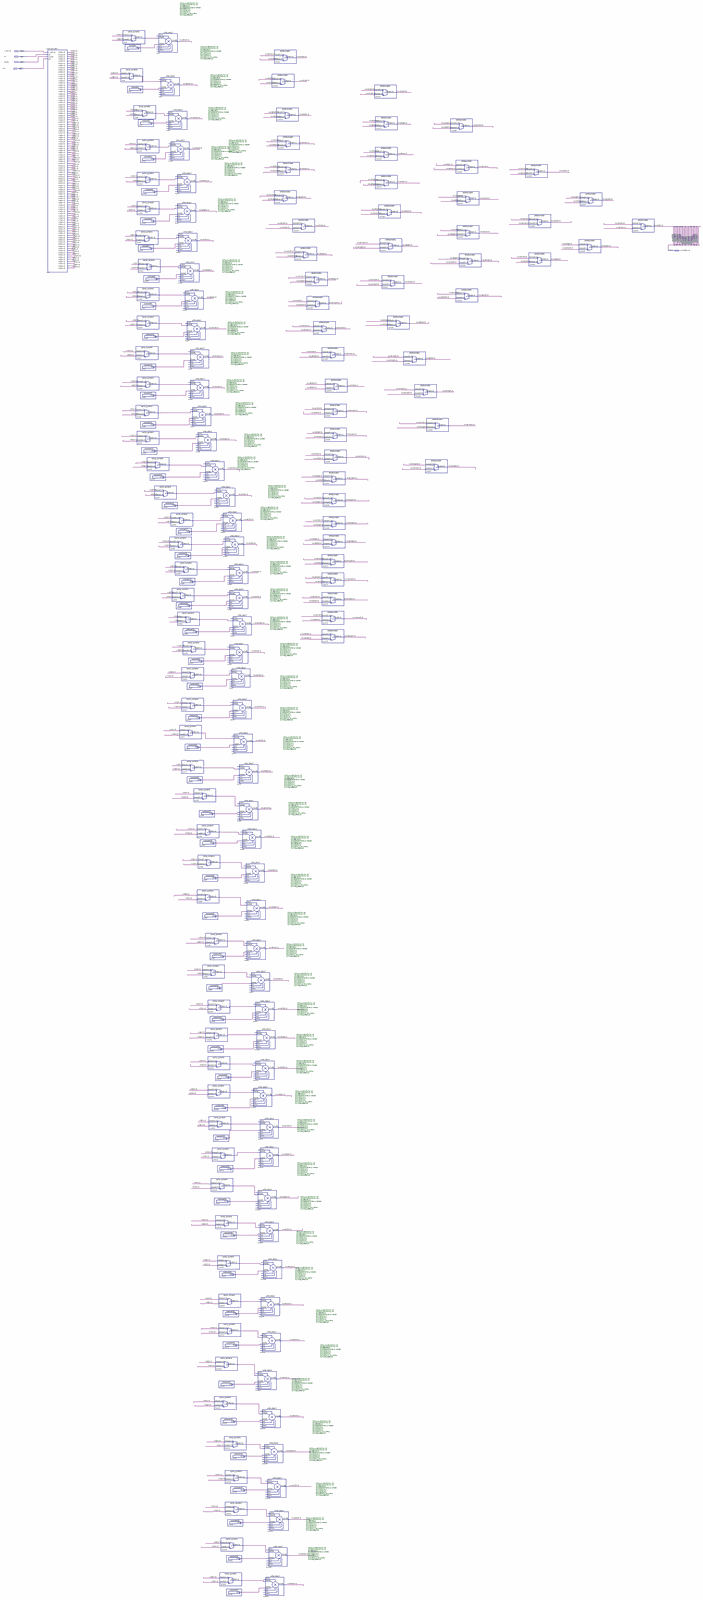
[diagram p0: schematic sheet, whole]
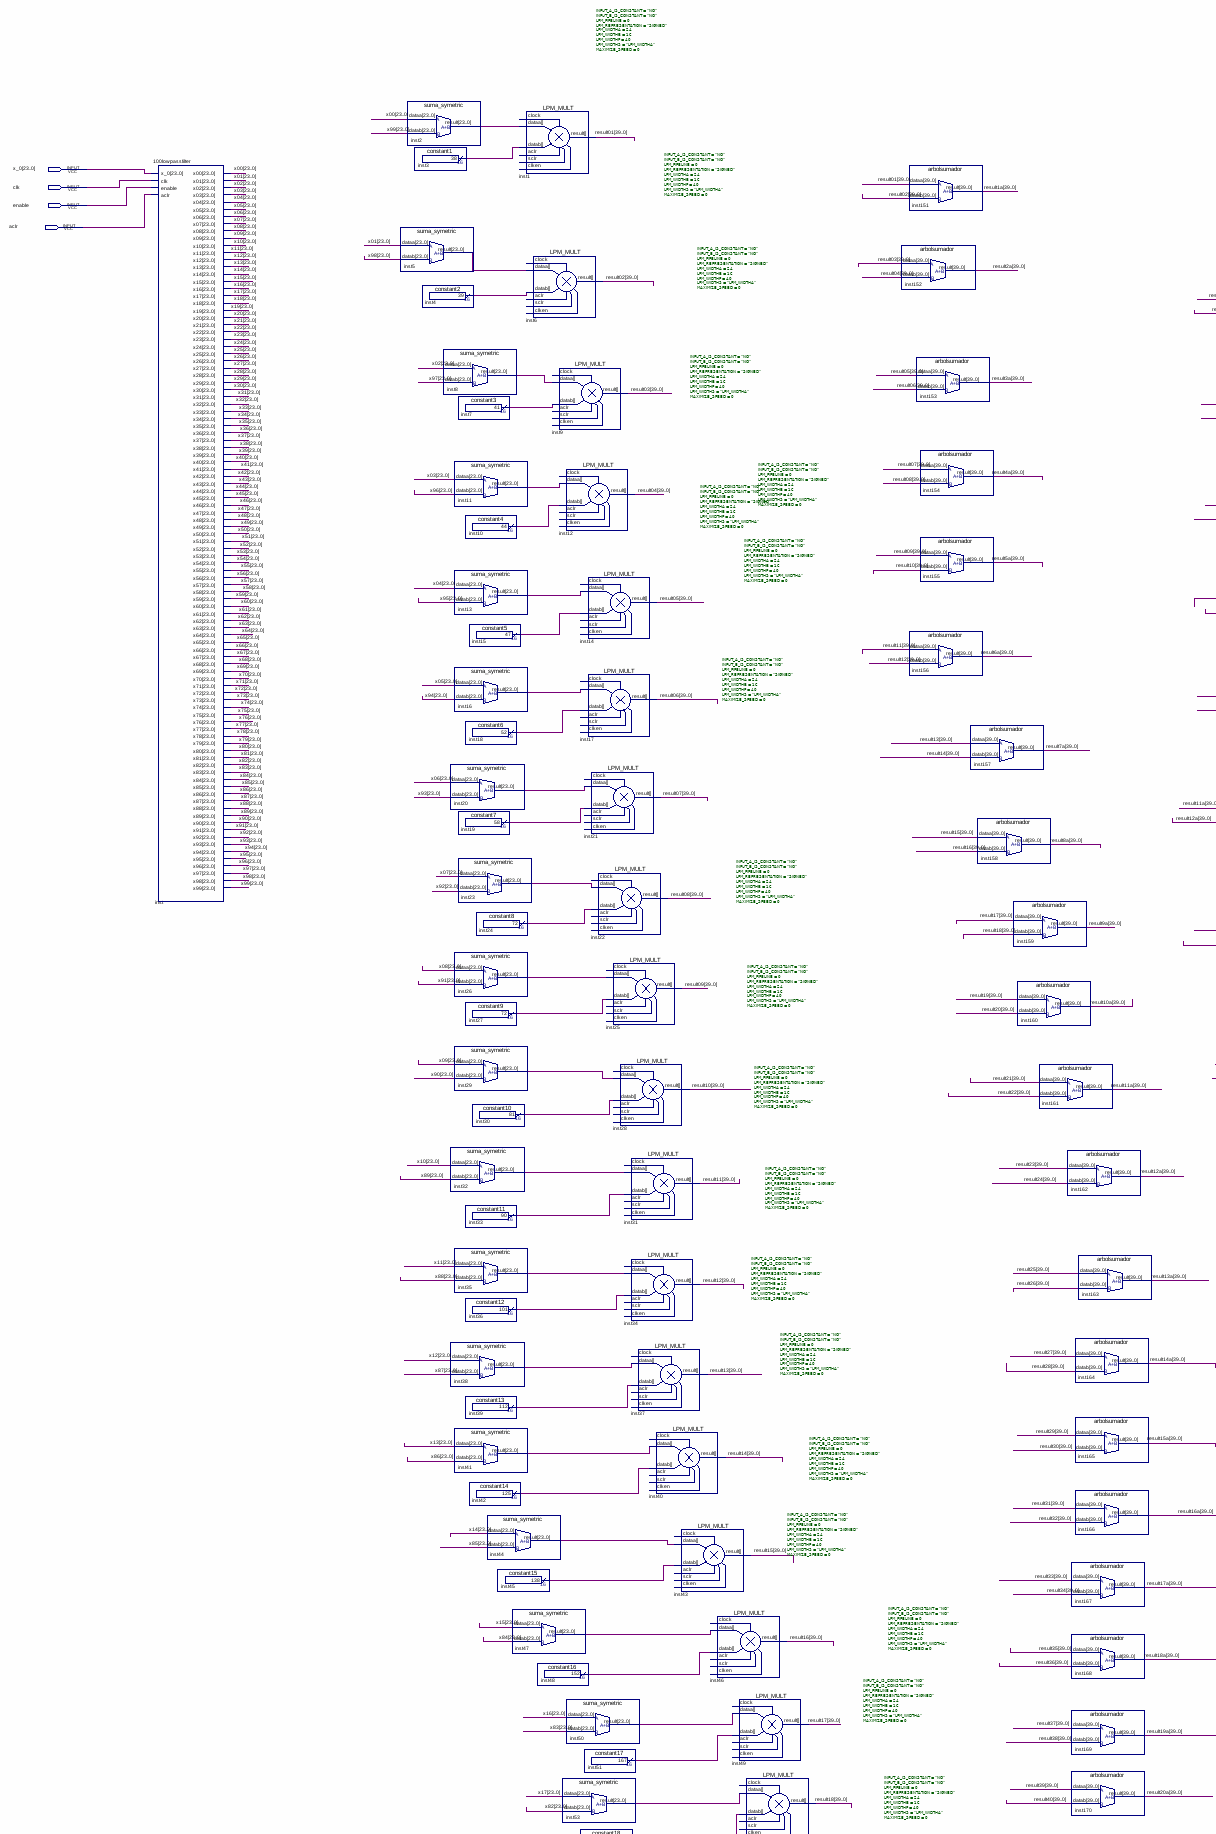
[diagram p1: schematic sheet, upper left part]
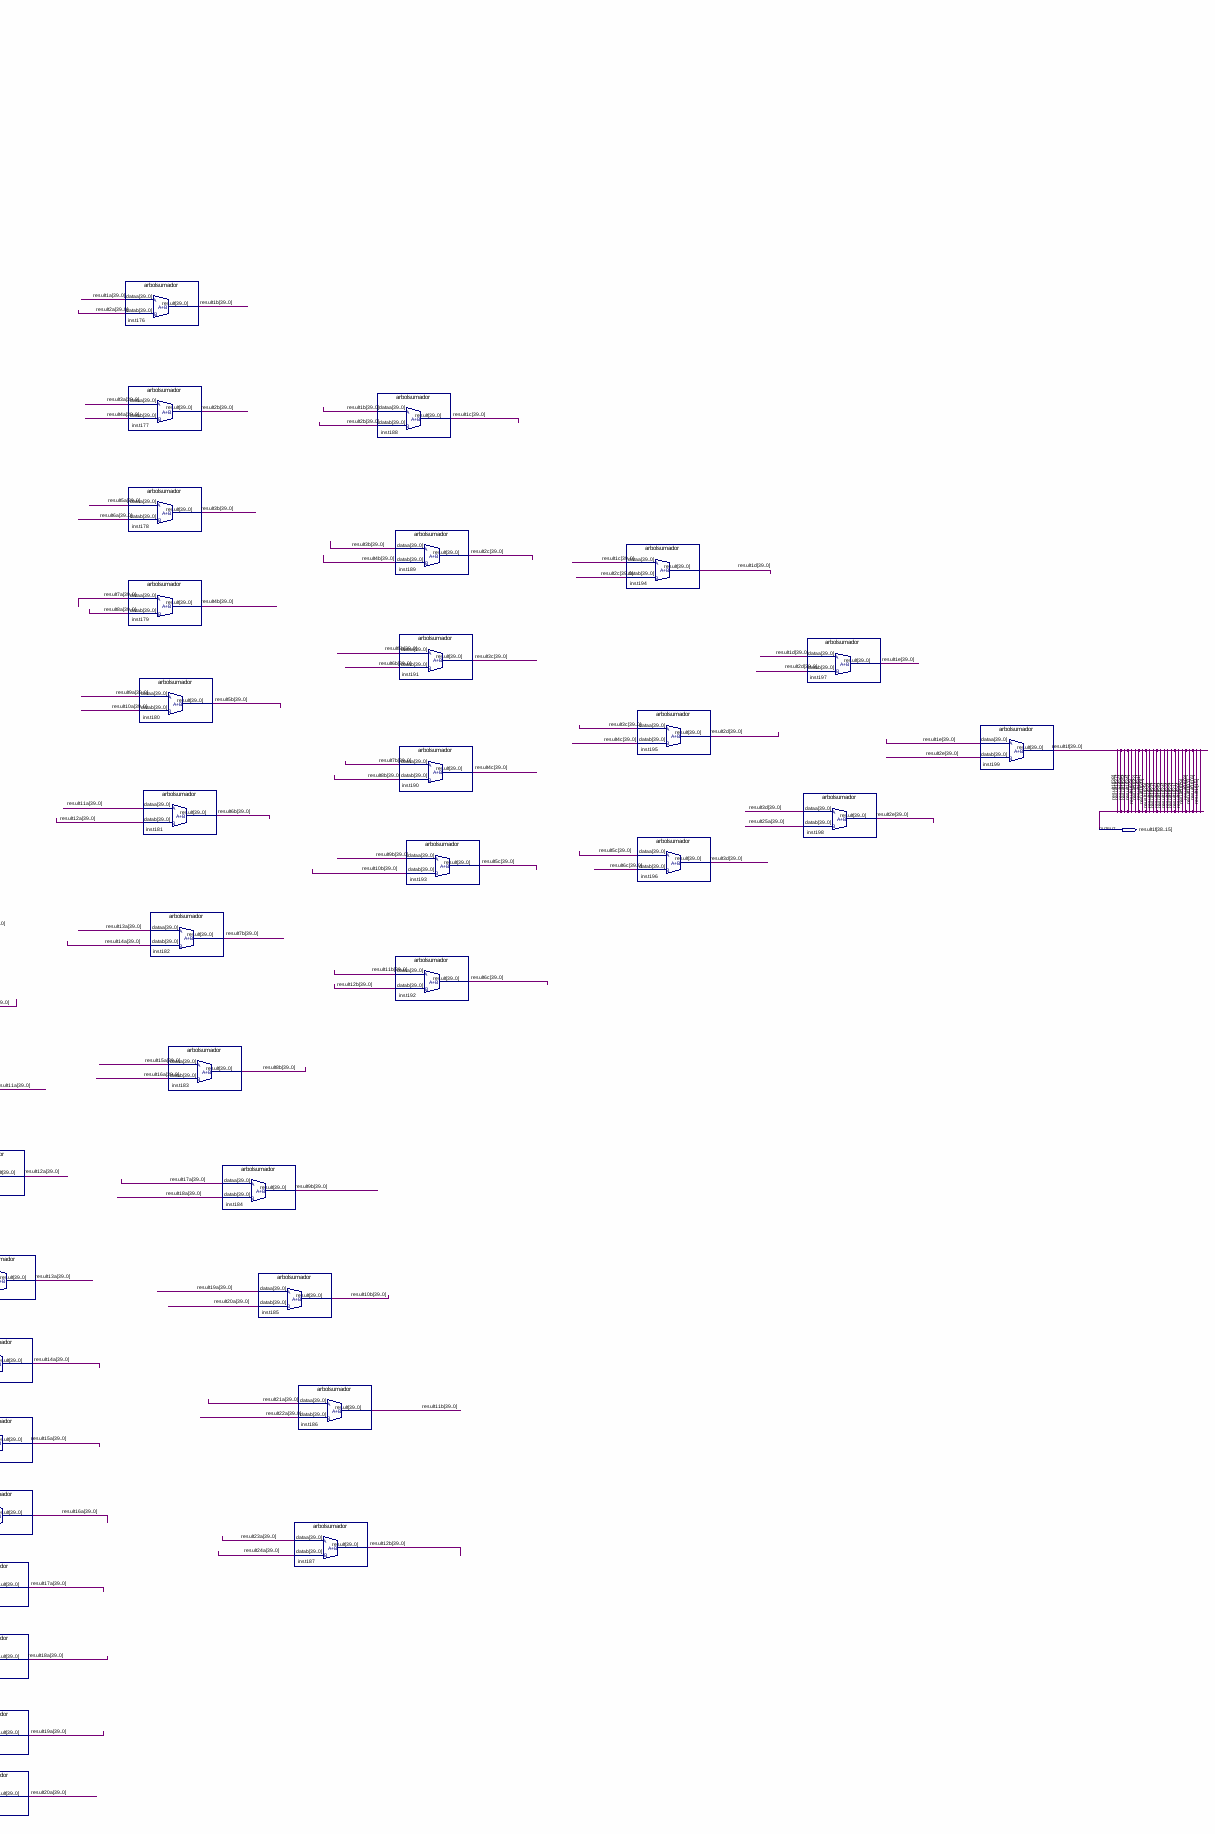
[diagram p2: schematic sheet, upper right part]
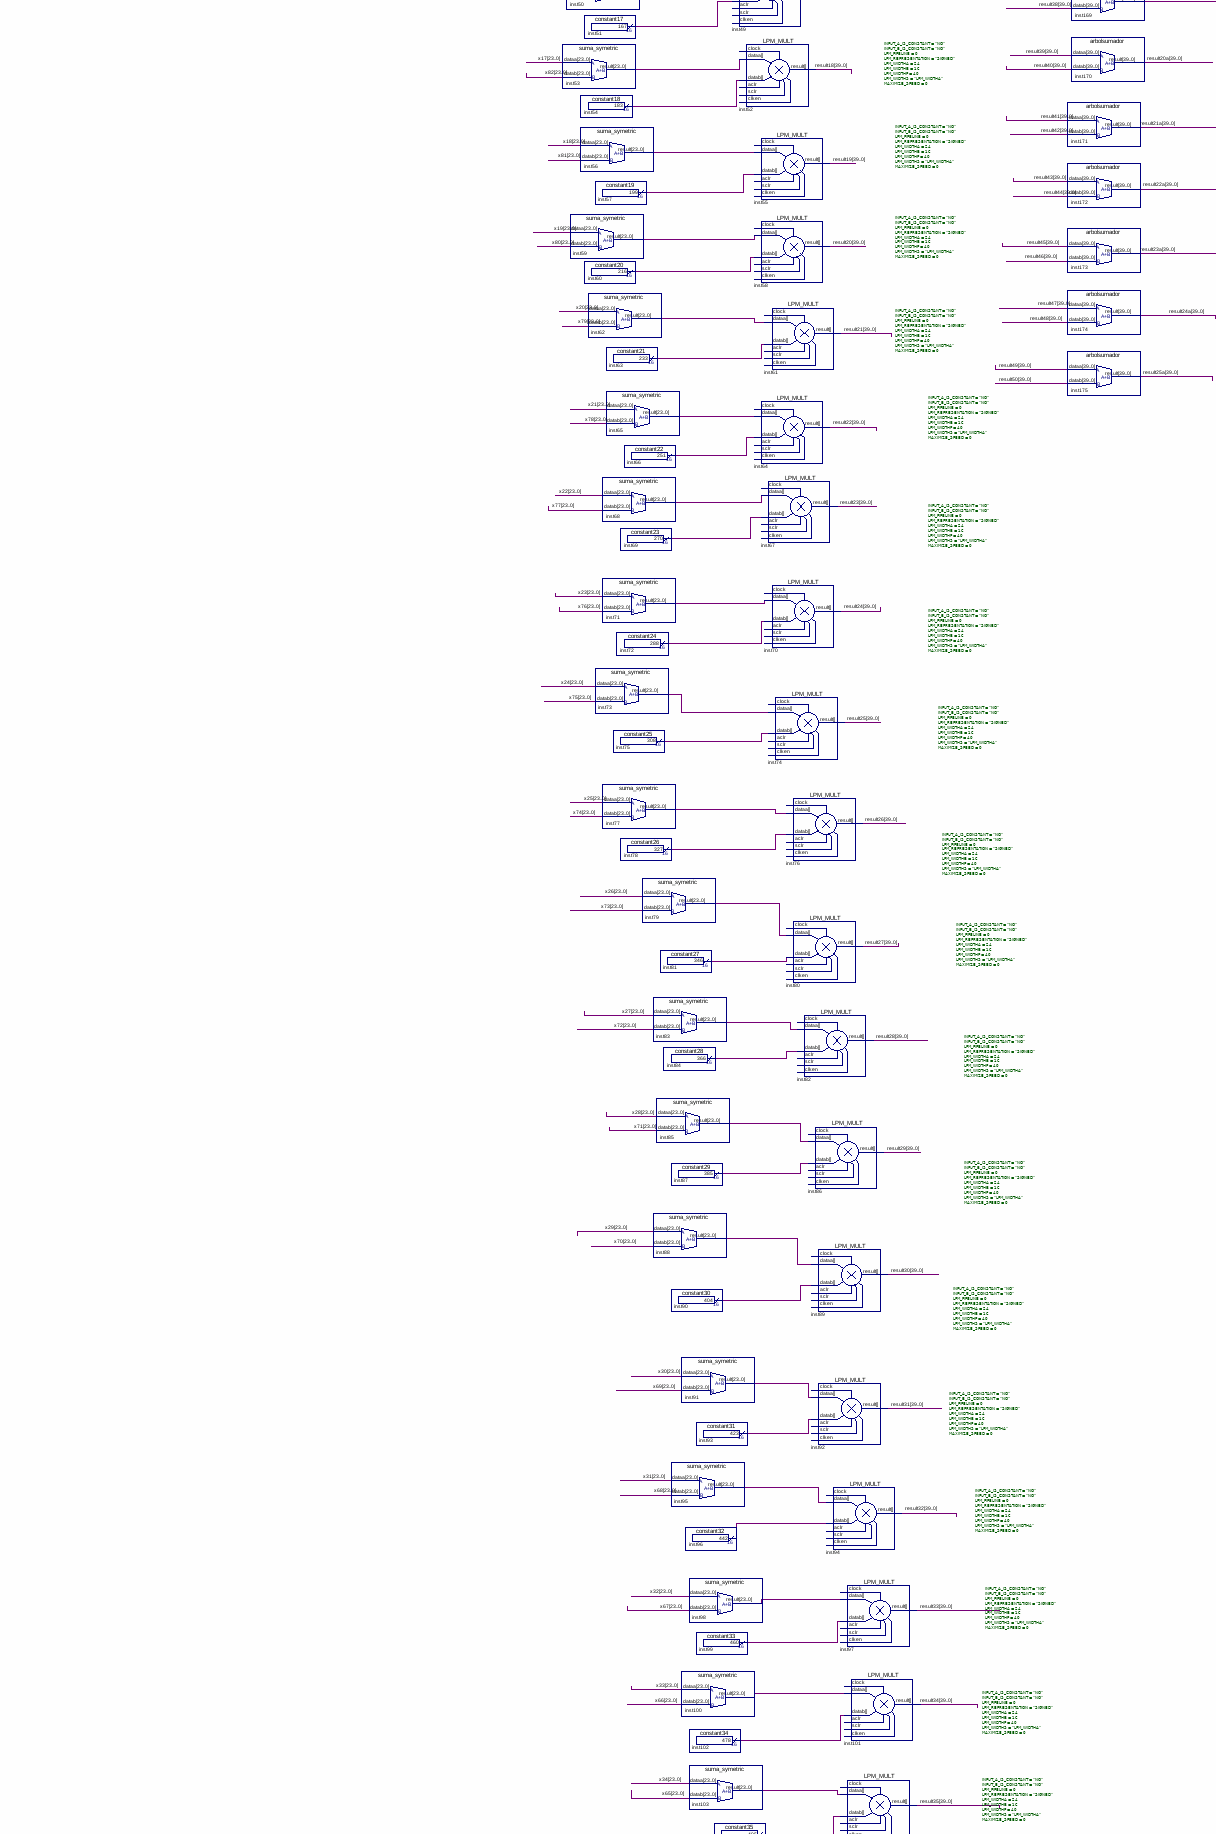
[diagram p3: schematic sheet, middle left part]
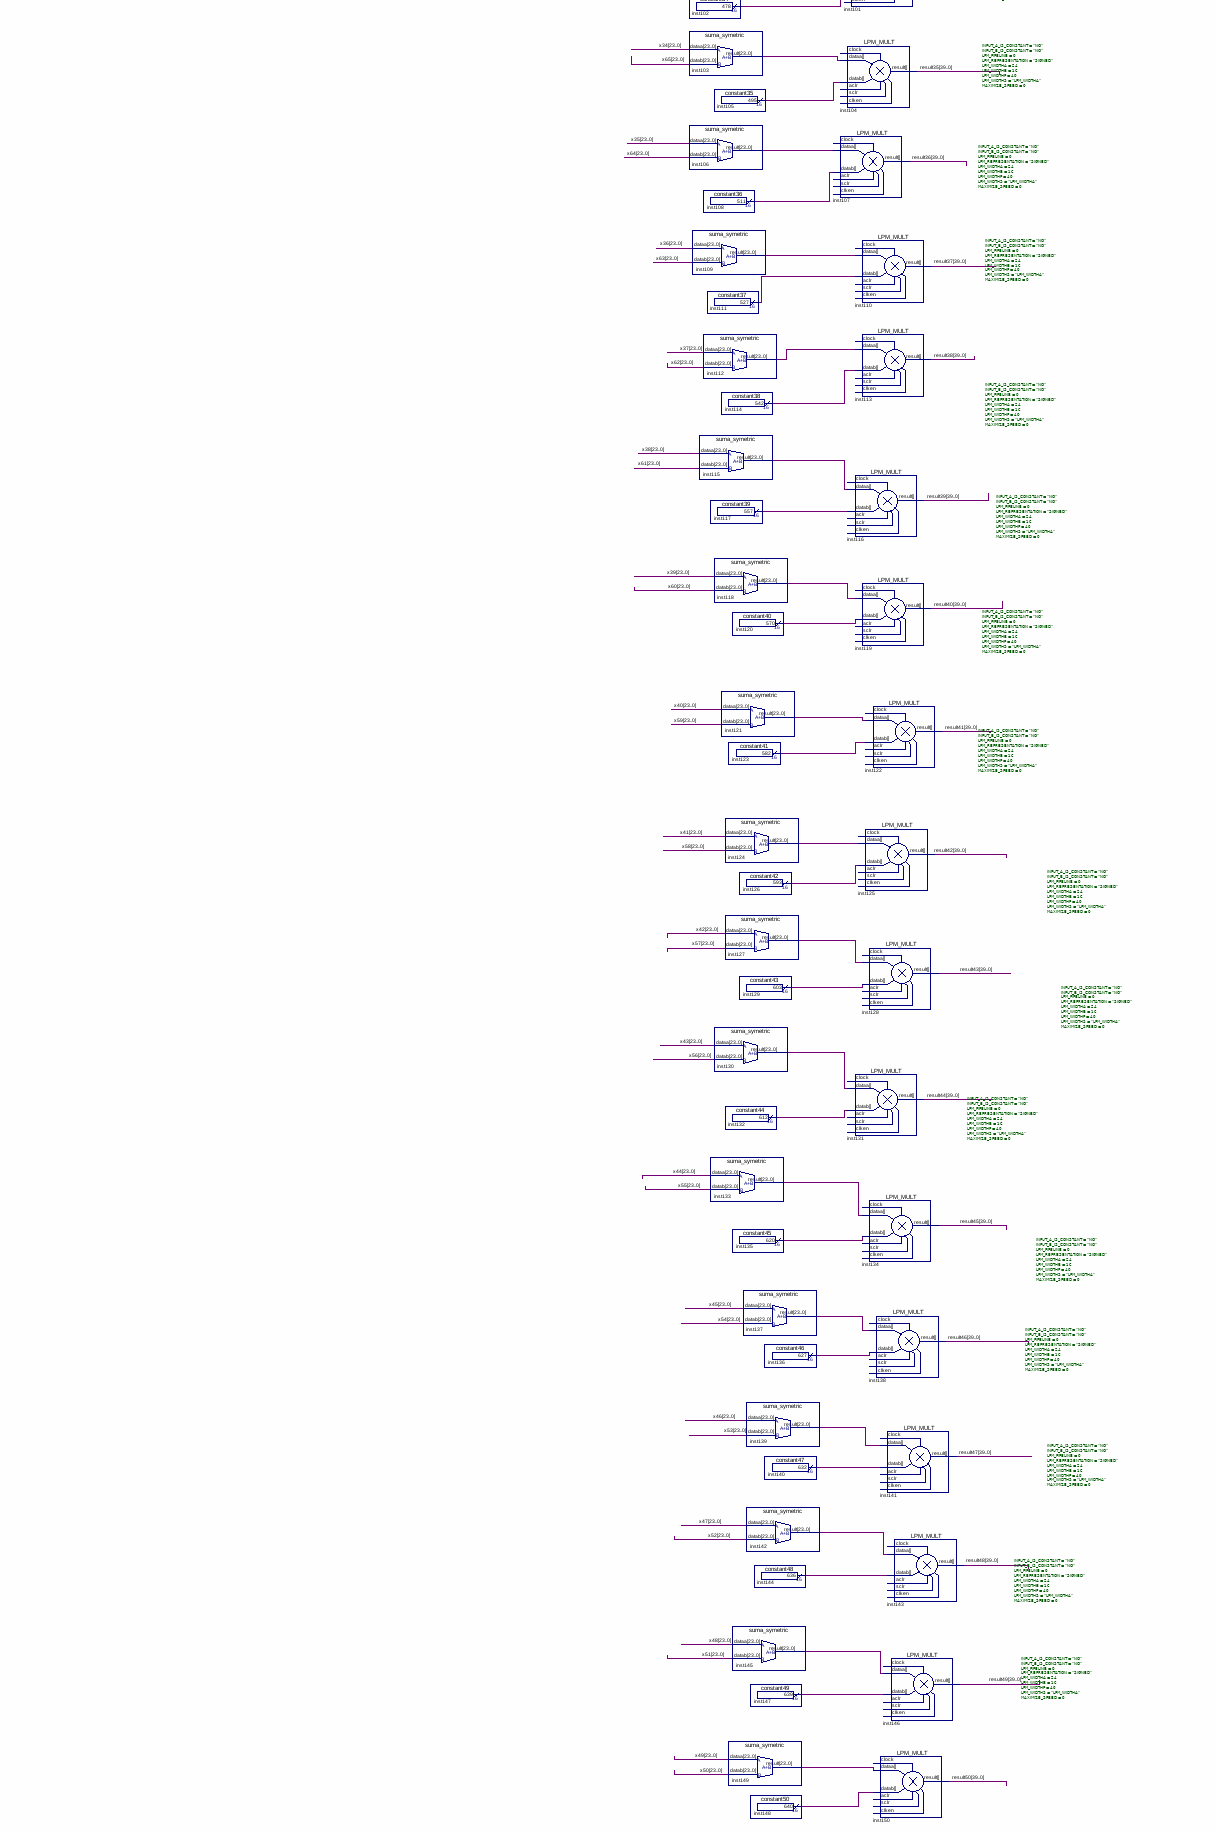
[diagram p4: schematic sheet, lower left part]
// Quartus schematic audiotest4formodifying2.bdf as structural Verilog: 200 symbols, 5 pins
module audiotest4formodifying2 (
  input  [23:0] x_0,
  input  clk,
  input  enable,
  input  aclr,
  output [39:0] result1f
);

  wire [15:0] inst3_result, inst4_result, inst7_result, inst10_result, inst15_result, inst18_result,
       inst19_result, inst24_result, inst27_result, inst30_result, inst33_result, inst36_result,
       inst39_result, inst42_result, inst45_result, inst48_result, inst51_result, inst54_result,
       inst57_result, inst60_result, inst63_result, inst66_result, inst69_result, inst72_result,
       inst75_result, inst78_result, inst81_result, inst84_result, inst87_result, inst90_result,
       inst93_result, inst96_result, inst99_result, inst102_result, inst105_result, inst108_result,
       inst111_result, inst114_result, inst117_result, inst120_result, inst123_result, inst126_result,
       inst129_result, inst132_result, inst135_result, inst136_result, inst140_result, inst144_result,
       inst147_result, inst148_result;
  wire [23:0] inst2_result, inst5_result, inst8_result, inst11_result, inst13_result, inst16_result,
       inst20_result, inst23_result, inst26_result, inst29_result, inst32_result, inst35_result,
       inst38_result, inst41_result, inst44_result, inst47_result, inst50_result, inst53_result,
       inst56_result, inst59_result, inst62_result, inst65_result, inst68_result, inst71_result,
       inst73_result, inst77_result, inst79_result, inst83_result, inst85_result, inst88_result,
       inst91_result, inst95_result, inst98_result, inst100_result, inst103_result, inst106_result,
       inst109_result, inst112_result, inst115_result, inst118_result, inst121_result, inst124_result,
       inst127_result, inst130_result, inst133_result, inst137_result, inst139_result, inst142_result,
       inst145_result, inst149_result, x00, x01, x02, x03, x04, x05, x06, x07, x08, x09, x10, x11, x12, x13,
       x14, x15, x16, x17, x18, x19, x20, x21, x22, x23, x24, x25, x26, x27, x28, x29, x30, x31, x32, x33,
       x34, x35, x36, x37, x38, x39, x40, x41, x42, x43, x44, x45, x46, x47, x48, x49, x50, x51, x52, x53,
       x54, x55, x56, x57, x58, x59, x60, x61, x62, x63, x64, x65, x66, x67, x68, x69, x70, x71, x72, x73,
       x74, x75, x76, x77, x78, x79, x80, x81, x82, x83, x84, x85, x86, x87, x88, x89, x90, x91, x92, x93,
       x94, x95, x96, x97, x98, x99;
  wire [39:0] result01, result1a, result1b, result1c, result1d, result1e, result02, result2a, result2b,
       result2c, result2d, result2e, result03, result3a, result3b, result3c, result3d, result04, result4a,
       result4b, result4c, result05, result5a, result5b, result5c, result06, result6a, result6b, result6c,
       result07, result7a, result7b, result08, result8a, result8b, result09, result9a, result9b, result10,
       result10a, result10b, result11, result11a, result11b, result12, result12a, result12b, result13,
       result13a, result14, result14a, result15, result15a, result16, result16a, result17, result17a,
       result18, result18a, result19, result19a, result20, result20a, result21, result21a, result22,
       result22a, result23, result23a, result24, result24a, result25, result25a, result26, result27,
       result28, result29, result30, result31, result32, result33, result34, result35, result36, result37,
       result38, result39, result40, result41, result42, result43, result44, result45, result46, result47,
       result48, result49, result50;

  \100lowpassfilter  inst (
    .x_0(x_0), .clk(clk), .enable(enable), .aclr(aclr), .x00(x00), .x01(x01), .x02(x02), .x03(x03),
    .x04(x04), .x05(x05), .x06(x06), .x07(x07), .x08(x08), .x09(x09), .x10(x10), .x11(x11), .x12(x12),
    .x13(x13), .x14(x14), .x15(x15), .x16(x16), .x17(x17), .x18(x18), .x19(x19), .x20(x20), .x21(x21),
    .x22(x22), .x23(x23), .x24(x24), .x25(x25), .x26(x26), .x27(x27), .x28(x28), .x29(x29), .x30(x30),
    .x31(x31), .x32(x32), .x33(x33), .x34(x34), .x35(x35), .x36(x36), .x37(x37), .x38(x38), .x39(x39),
    .x40(x40), .x41(x41), .x42(x42), .x43(x43), .x44(x44), .x45(x45), .x46(x46), .x47(x47), .x48(x48),
    .x49(x49), .x50(x50), .x51(x51), .x52(x52), .x53(x53), .x54(x54), .x55(x55), .x56(x56), .x57(x57),
    .x58(x58), .x59(x59), .x60(x60), .x61(x61), .x62(x62), .x63(x63), .x64(x64), .x65(x65), .x66(x66),
    .x67(x67), .x68(x68), .x69(x69), .x70(x70), .x71(x71), .x72(x72), .x73(x73), .x74(x74), .x75(x75),
    .x76(x76), .x77(x77), .x78(x78), .x79(x79), .x80(x80), .x81(x81), .x82(x82), .x83(x83), .x84(x84),
    .x85(x85), .x86(x86), .x87(x87), .x88(x88), .x89(x89), .x90(x90), .x91(x91), .x92(x92), .x93(x93),
    .x94(x94), .x95(x95), .x96(x96), .x97(x97), .x98(x98), .x99(x99));
  suma_symetric inst2 (.dataa(x00), .datab(x99), .result(inst2_result));
  suma_symetric inst5 (.dataa(x01), .datab(x98), .result(inst5_result));
  constant1 inst3 (.result(inst3_result));
  constant2 inst4 (.result(inst4_result));
  suma_symetric inst8 (.dataa(x02), .datab(x97), .result(inst8_result));
  constant3 inst7 (.result(inst7_result));
  suma_symetric inst11 (.dataa(x03), .datab(x96), .result(inst11_result));
  constant4 inst10 (.result(inst10_result));
  suma_symetric inst13 (.dataa(x04), .datab(x95), .result(inst13_result));
  constant5 inst15 (.result(inst15_result));
  suma_symetric inst16 (.dataa(x05), .datab(x94), .result(inst16_result));
  constant6 inst18 (.result(inst18_result));
  suma_symetric inst20 (.dataa(x06), .datab(x93), .result(inst20_result));
  constant7 inst19 (.result(inst19_result));
  suma_symetric inst23 (.dataa(x07), .datab(x92), .result(inst23_result));
  suma_symetric inst26 (.dataa(x08), .datab(x91), .result(inst26_result));
  constant9 inst27 (.result(inst27_result));
  suma_symetric inst29 (.dataa(x09), .datab(x90), .result(inst29_result));
  suma_symetric inst32 (.dataa(x10), .datab(x89), .result(inst32_result));
  constant11 inst33 (.result(inst33_result));
  suma_symetric inst35 (.dataa(x11), .datab(x88), .result(inst35_result));
  constant12 inst36 (.result(inst36_result));
  suma_symetric inst38 (.dataa(x12), .datab(x87), .result(inst38_result));
  constant13 inst39 (.result(inst39_result));
  suma_symetric inst41 (.dataa(x13), .datab(x86), .result(inst41_result));
  constant14 inst42 (.result(inst42_result));
  constant8 inst24 (.result(inst24_result));
  constant10 inst30 (.result(inst30_result));
  suma_symetric inst44 (.dataa(x14), .datab(x85), .result(inst44_result));
  constant15 inst45 (.result(inst45_result));
  LPM_MULT #(.INPUT_A_IS_CONSTANT("NO"), .INPUT_B_IS_CONSTANT("NO"), .LPM_PIPELINE(0), .LPM_REPRESENTATION("SIGNED"), .LPM_WIDTHA(24), .LPM_WIDTHB(16), .LPM_WIDTHP(40), .LPM_WIDTHS("LPM_WIDTHA"), .MAXIMIZE_SPEED(0)) inst1 (
    .dataa(inst2_result), .datab(inst3_result), .result(result01));  // open: clock, aclr, sclr, clken
  LPM_MULT #(.INPUT_A_IS_CONSTANT("NO"), .INPUT_B_IS_CONSTANT("NO"), .LPM_PIPELINE(0), .LPM_REPRESENTATION("SIGNED"), .LPM_WIDTHA(24), .LPM_WIDTHB(16), .LPM_WIDTHP(40), .LPM_WIDTHS("LPM_WIDTHA"), .MAXIMIZE_SPEED(0)) inst6 (
    .dataa(inst5_result), .datab(inst4_result), .result(result02));  // open: clock, aclr, sclr, clken
  suma_symetric inst47 (.dataa(x15), .datab(x84), .result(inst47_result));
  LPM_MULT #(.INPUT_A_IS_CONSTANT("NO"), .INPUT_B_IS_CONSTANT("NO"), .LPM_PIPELINE(0), .LPM_REPRESENTATION("SIGNED"), .LPM_WIDTHA(24), .LPM_WIDTHB(16), .LPM_WIDTHP(40), .LPM_WIDTHS("LPM_WIDTHA"), .MAXIMIZE_SPEED(0)) inst9 (
    .dataa(inst8_result), .datab(inst7_result), .result(result03));  // open: clock, aclr, sclr, clken
  constant16 inst48 (.result(inst48_result));
  LPM_MULT #(.INPUT_A_IS_CONSTANT("NO"), .INPUT_B_IS_CONSTANT("NO"), .LPM_PIPELINE(0), .LPM_REPRESENTATION("SIGNED"), .LPM_WIDTHA(24), .LPM_WIDTHB(16), .LPM_WIDTHP(40), .LPM_WIDTHS("LPM_WIDTHA"), .MAXIMIZE_SPEED(0)) inst12 (
    .dataa(inst11_result), .datab(inst10_result), .result(result04));  // open: clock, aclr, sclr, clken
  LPM_MULT #(.INPUT_A_IS_CONSTANT("NO"), .INPUT_B_IS_CONSTANT("NO"), .LPM_PIPELINE(0), .LPM_REPRESENTATION("SIGNED"), .LPM_WIDTHA(24), .LPM_WIDTHB(16), .LPM_WIDTHP(40), .LPM_WIDTHS("LPM_WIDTHA"), .MAXIMIZE_SPEED(0)) inst14 (
    .dataa(inst13_result), .datab(inst15_result), .result(result05));  // open: clock, aclr, sclr, clken
  LPM_MULT #(.INPUT_A_IS_CONSTANT("NO"), .INPUT_B_IS_CONSTANT("NO"), .LPM_PIPELINE(0), .LPM_REPRESENTATION("SIGNED"), .LPM_WIDTHA(24), .LPM_WIDTHB(16), .LPM_WIDTHP(40), .LPM_WIDTHS("LPM_WIDTHA"), .MAXIMIZE_SPEED(0)) inst17 (
    .dataa(inst16_result), .datab(inst18_result), .result(result06));  // open: clock, aclr, sclr, clken
  LPM_MULT #(.INPUT_A_IS_CONSTANT("NO"), .INPUT_B_IS_CONSTANT("NO"), .LPM_PIPELINE(0), .LPM_REPRESENTATION("SIGNED"), .LPM_WIDTHA(24), .LPM_WIDTHB(16), .LPM_WIDTHP(40), .LPM_WIDTHS("LPM_WIDTHA"), .MAXIMIZE_SPEED(0)) inst21 (
    .dataa(inst20_result), .datab(inst19_result), .result(result07));  // open: clock, aclr, sclr, clken
  suma_symetric inst50 (.dataa(x16), .datab(x83), .result(inst50_result));
  constant17 inst51 (.result(inst51_result));
  suma_symetric inst53 (.dataa(x17), .datab(x82), .result(inst53_result));
  constant18 inst54 (.result(inst54_result));
  suma_symetric inst56 (.dataa(x18), .datab(x81), .result(inst56_result));
  suma_symetric inst59 (.dataa(x19), .datab(x80), .result(inst59_result));
  constant20 inst60 (.result(inst60_result));
  LPM_MULT #(.INPUT_A_IS_CONSTANT("NO"), .INPUT_B_IS_CONSTANT("NO"), .LPM_PIPELINE(0), .LPM_REPRESENTATION("SIGNED"), .LPM_WIDTHA(24), .LPM_WIDTHB(16), .LPM_WIDTHP(40), .LPM_WIDTHS("LPM_WIDTHA"), .MAXIMIZE_SPEED(0)) inst22 (
    .dataa(inst23_result), .datab(inst24_result), .result(result08));  // open: clock, aclr, sclr, clken
  LPM_MULT #(.INPUT_A_IS_CONSTANT("NO"), .INPUT_B_IS_CONSTANT("NO"), .LPM_PIPELINE(0), .LPM_REPRESENTATION("SIGNED"), .LPM_WIDTHA(24), .LPM_WIDTHB(16), .LPM_WIDTHP(40), .LPM_WIDTHS("LPM_WIDTHA"), .MAXIMIZE_SPEED(0)) inst25 (
    .dataa(inst26_result), .datab(inst27_result), .result(result09));  // open: clock, aclr, sclr, clken
  LPM_MULT #(.INPUT_A_IS_CONSTANT("NO"), .INPUT_B_IS_CONSTANT("NO"), .LPM_PIPELINE(0), .LPM_REPRESENTATION("SIGNED"), .LPM_WIDTHA(24), .LPM_WIDTHB(16), .LPM_WIDTHP(40), .LPM_WIDTHS("LPM_WIDTHA"), .MAXIMIZE_SPEED(0)) inst28 (
    .dataa(inst29_result), .datab(inst30_result), .result(result10));  // open: clock, aclr, sclr, clken
  constant19 inst57 (.result(inst57_result));
  suma_symetric inst62 (.dataa(x20), .datab(x79), .result(inst62_result));
  constant21 inst63 (.result(inst63_result));
  suma_symetric inst65 (.dataa(x21), .datab(x78), .result(inst65_result));
  suma_symetric inst68 (.dataa(x22), .datab(x77), .result(inst68_result));
  suma_symetric inst71 (.dataa(x23), .datab(x76), .result(inst71_result));
  suma_symetric inst73 (.dataa(x24), .datab(x75), .result(inst73_result));
  constant25 inst75 (.result(inst75_result));
  suma_symetric inst77 (.dataa(x25), .datab(x74), .result(inst77_result));
  LPM_MULT #(.INPUT_A_IS_CONSTANT("NO"), .INPUT_B_IS_CONSTANT("NO"), .LPM_PIPELINE(0), .LPM_REPRESENTATION("SIGNED"), .LPM_WIDTHA(24), .LPM_WIDTHB(16), .LPM_WIDTHP(40), .LPM_WIDTHS("LPM_WIDTHA"), .MAXIMIZE_SPEED(0)) inst31 (
    .dataa(inst32_result), .datab(inst33_result), .result(result11));  // open: clock, aclr, sclr, clken
  LPM_MULT #(.INPUT_A_IS_CONSTANT("NO"), .INPUT_B_IS_CONSTANT("NO"), .LPM_PIPELINE(0), .LPM_REPRESENTATION("SIGNED"), .LPM_WIDTHA(24), .LPM_WIDTHB(16), .LPM_WIDTHP(40), .LPM_WIDTHS("LPM_WIDTHA"), .MAXIMIZE_SPEED(0)) inst34 (
    .dataa(inst35_result), .datab(inst36_result), .result(result12));  // open: clock, aclr, sclr, clken
  LPM_MULT #(.INPUT_A_IS_CONSTANT("NO"), .INPUT_B_IS_CONSTANT("NO"), .LPM_PIPELINE(0), .LPM_REPRESENTATION("SIGNED"), .LPM_WIDTHA(24), .LPM_WIDTHB(16), .LPM_WIDTHP(40), .LPM_WIDTHS("LPM_WIDTHA"), .MAXIMIZE_SPEED(0)) inst37 (
    .dataa(inst38_result), .datab(inst39_result), .result(result13));  // open: clock, aclr, sclr, clken
  constant22 inst66 (.result(inst66_result));
  constant23 inst69 (.result(inst69_result));
  constant24 inst72 (.result(inst72_result));
  constant26 inst78 (.result(inst78_result));
  suma_symetric inst79 (.dataa(x26), .datab(x73), .result(inst79_result));
  LPM_MULT #(.INPUT_A_IS_CONSTANT("NO"), .INPUT_B_IS_CONSTANT("NO"), .LPM_PIPELINE(0), .LPM_REPRESENTATION("SIGNED"), .LPM_WIDTHA(24), .LPM_WIDTHB(16), .LPM_WIDTHP(40), .LPM_WIDTHS("LPM_WIDTHA"), .MAXIMIZE_SPEED(0)) inst40 (
    .dataa(inst41_result), .datab(inst42_result), .result(result14));  // open: clock, aclr, sclr, clken
  constant27 inst81 (.result(inst81_result));
  suma_symetric inst83 (.dataa(x27), .datab(x72), .result(inst83_result));
  constant28 inst84 (.result(inst84_result));
  suma_symetric inst85 (.dataa(x28), .datab(x71), .result(inst85_result));
  constant29 inst87 (.result(inst87_result));
  suma_symetric inst88 (.dataa(x29), .datab(x70), .result(inst88_result));
  constant30 inst90 (.result(inst90_result));
  suma_symetric inst95 (.dataa(x31), .datab(x68), .result(inst95_result));
  LPM_MULT #(.INPUT_A_IS_CONSTANT("NO"), .INPUT_B_IS_CONSTANT("NO"), .LPM_PIPELINE(0), .LPM_REPRESENTATION("SIGNED"), .LPM_WIDTHA(24), .LPM_WIDTHB(16), .LPM_WIDTHP(40), .LPM_WIDTHS("LPM_WIDTHA"), .MAXIMIZE_SPEED(0)) inst43 (
    .dataa(inst44_result), .datab(inst45_result), .result(result15));  // open: clock, aclr, sclr, clken
  suma_symetric inst91 (.dataa(x30), .datab(x69), .result(inst91_result));
  constant31 inst93 (.result(inst93_result));
  constant32 inst96 (.result(inst96_result));
  suma_symetric inst98 (.dataa(x32), .datab(x67), .result(inst98_result));
  constant33 inst99 (.result(inst99_result));
  suma_symetric inst100 (.dataa(x33), .datab(x66), .result(inst100_result));
  constant34 inst102 (.result(inst102_result));
  suma_symetric inst103 (.dataa(x34), .datab(x65), .result(inst103_result));
  suma_symetric inst106 (.dataa(x35), .datab(x64), .result(inst106_result));
  suma_symetric inst109 (.dataa(x36), .datab(x63), .result(inst109_result));
  suma_symetric inst115 (.dataa(x38), .datab(x61), .result(inst115_result));
  LPM_MULT #(.INPUT_A_IS_CONSTANT("NO"), .INPUT_B_IS_CONSTANT("NO"), .LPM_PIPELINE(0), .LPM_REPRESENTATION("SIGNED"), .LPM_WIDTHA(24), .LPM_WIDTHB(16), .LPM_WIDTHP(40), .LPM_WIDTHS("LPM_WIDTHA"), .MAXIMIZE_SPEED(0)) inst46 (
    .dataa(inst47_result), .datab(inst48_result), .result(result16));  // open: clock, aclr, sclr, clken
  constant35 inst105 (.result(inst105_result));
  constant36 inst108 (.result(inst108_result));
  constant37 inst111 (.result(inst111_result));
  suma_symetric inst112 (.dataa(x37), .datab(x62), .result(inst112_result));
  constant38 inst114 (.result(inst114_result));
  constant39 inst117 (.result(inst117_result));
  suma_symetric inst118 (.dataa(x39), .datab(x60), .result(inst118_result));
  suma_symetric inst121 (.dataa(x40), .datab(x59), .result(inst121_result));
  constant41 inst123 (.result(inst123_result));
  suma_symetric inst124 (.dataa(x41), .datab(x58), .result(inst124_result));
  suma_symetric inst127 (.dataa(x42), .datab(x57), .result(inst127_result));
  suma_symetric inst130 (.dataa(x43), .datab(x56), .result(inst130_result));
  constant44 inst132 (.result(inst132_result));
  suma_symetric inst133 (.dataa(x44), .datab(x55), .result(inst133_result));
  suma_symetric inst149 (.dataa(x49), .datab(x50), .result(inst149_result));
  LPM_MULT #(.INPUT_A_IS_CONSTANT("NO"), .INPUT_B_IS_CONSTANT("NO"), .LPM_PIPELINE(0), .LPM_REPRESENTATION("SIGNED"), .LPM_WIDTHA(24), .LPM_WIDTHB(16), .LPM_WIDTHP(40), .LPM_WIDTHS("LPM_WIDTHA"), .MAXIMIZE_SPEED(0)) inst49 (
    .dataa(inst50_result), .datab(inst51_result), .result(result17));  // open: clock, aclr, sclr, clken
  LPM_MULT #(.INPUT_A_IS_CONSTANT("NO"), .INPUT_B_IS_CONSTANT("NO"), .LPM_PIPELINE(0), .LPM_REPRESENTATION("SIGNED"), .LPM_WIDTHA(24), .LPM_WIDTHB(16), .LPM_WIDTHP(40), .LPM_WIDTHS("LPM_WIDTHA"), .MAXIMIZE_SPEED(0)) inst52 (
    .dataa(inst53_result), .datab(inst54_result), .result(result18));  // open: clock, aclr, sclr, clken
  LPM_MULT #(.INPUT_A_IS_CONSTANT("NO"), .INPUT_B_IS_CONSTANT("NO"), .LPM_PIPELINE(0), .LPM_REPRESENTATION("SIGNED"), .LPM_WIDTHA(24), .LPM_WIDTHB(16), .LPM_WIDTHP(40), .LPM_WIDTHS("LPM_WIDTHA"), .MAXIMIZE_SPEED(0)) inst55 (
    .dataa(inst56_result), .datab(inst57_result), .result(result19));  // open: clock, aclr, sclr, clken
  LPM_MULT #(.INPUT_A_IS_CONSTANT("NO"), .INPUT_B_IS_CONSTANT("NO"), .LPM_PIPELINE(0), .LPM_REPRESENTATION("SIGNED"), .LPM_WIDTHA(24), .LPM_WIDTHB(16), .LPM_WIDTHP(40), .LPM_WIDTHS("LPM_WIDTHA"), .MAXIMIZE_SPEED(0)) inst58 (
    .dataa(inst59_result), .datab(inst60_result), .result(result20));  // open: clock, aclr, sclr, clken
  LPM_MULT #(.INPUT_A_IS_CONSTANT("NO"), .INPUT_B_IS_CONSTANT("NO"), .LPM_PIPELINE(0), .LPM_REPRESENTATION("SIGNED"), .LPM_WIDTHA(24), .LPM_WIDTHB(16), .LPM_WIDTHP(40), .LPM_WIDTHS("LPM_WIDTHA"), .MAXIMIZE_SPEED(0)) inst64 (
    .dataa(inst65_result), .datab(inst66_result), .result(result22));  // open: clock, aclr, sclr, clken
  constant40 inst120 (.result(inst120_result));
  constant42 inst126 (.result(inst126_result));
  constant43 inst129 (.result(inst129_result));
  constant45 inst135 (.result(inst135_result));
  suma_symetric inst137 (.dataa(x45), .datab(x54), .result(inst137_result));
  suma_symetric inst139 (.dataa(x46), .datab(x53), .result(inst139_result));
  suma_symetric inst142 (.dataa(x47), .datab(x52), .result(inst142_result));
  constant48 inst144 (.result(inst144_result));
  suma_symetric inst145 (.dataa(x48), .datab(x51), .result(inst145_result));
  constant49 inst147 (.result(inst147_result));
  constant50 inst148 (.result(inst148_result));
  LPM_MULT #(.INPUT_A_IS_CONSTANT("NO"), .INPUT_B_IS_CONSTANT("NO"), .LPM_PIPELINE(0), .LPM_REPRESENTATION("SIGNED"), .LPM_WIDTHA(24), .LPM_WIDTHB(16), .LPM_WIDTHP(40), .LPM_WIDTHS("LPM_WIDTHA"), .MAXIMIZE_SPEED(0)) inst61 (
    .dataa(inst62_result), .datab(inst63_result), .result(result21));  // open: clock, aclr, sclr, clken
  LPM_MULT #(.INPUT_A_IS_CONSTANT("NO"), .INPUT_B_IS_CONSTANT("NO"), .LPM_PIPELINE(0), .LPM_REPRESENTATION("SIGNED"), .LPM_WIDTHA(24), .LPM_WIDTHB(16), .LPM_WIDTHP(40), .LPM_WIDTHS("LPM_WIDTHA"), .MAXIMIZE_SPEED(0)) inst67 (
    .dataa(inst68_result), .datab(inst69_result), .result(result23));  // open: clock, aclr, sclr, clken
  LPM_MULT #(.INPUT_A_IS_CONSTANT("NO"), .INPUT_B_IS_CONSTANT("NO"), .LPM_PIPELINE(0), .LPM_REPRESENTATION("SIGNED"), .LPM_WIDTHA(24), .LPM_WIDTHB(16), .LPM_WIDTHP(40), .LPM_WIDTHS("LPM_WIDTHA"), .MAXIMIZE_SPEED(0)) inst70 (
    .dataa(inst71_result), .datab(inst72_result), .result(result24));  // open: clock, aclr, sclr, clken
  LPM_MULT #(.INPUT_A_IS_CONSTANT("NO"), .INPUT_B_IS_CONSTANT("NO"), .LPM_PIPELINE(0), .LPM_REPRESENTATION("SIGNED"), .LPM_WIDTHA(24), .LPM_WIDTHB(16), .LPM_WIDTHP(40), .LPM_WIDTHS("LPM_WIDTHA"), .MAXIMIZE_SPEED(0)) inst74 (
    .dataa(inst73_result), .datab(inst75_result), .result(result25));  // open: clock, aclr, sclr, clken
  LPM_MULT #(.INPUT_A_IS_CONSTANT("NO"), .INPUT_B_IS_CONSTANT("NO"), .LPM_PIPELINE(0), .LPM_REPRESENTATION("SIGNED"), .LPM_WIDTHA(24), .LPM_WIDTHB(16), .LPM_WIDTHP(40), .LPM_WIDTHS("LPM_WIDTHA"), .MAXIMIZE_SPEED(0)) inst76 (
    .dataa(inst77_result), .datab(inst78_result), .result(result26));  // open: clock, aclr, sclr, clken
  LPM_MULT #(.INPUT_A_IS_CONSTANT("NO"), .INPUT_B_IS_CONSTANT("NO"), .LPM_PIPELINE(0), .LPM_REPRESENTATION("SIGNED"), .LPM_WIDTHA(24), .LPM_WIDTHB(16), .LPM_WIDTHP(40), .LPM_WIDTHS("LPM_WIDTHA"), .MAXIMIZE_SPEED(0)) inst80 (
    .dataa(inst79_result), .datab(inst81_result), .result(result27));  // open: clock, aclr, sclr, clken
  constant46 inst136 (.result(inst136_result));
  constant47 inst140 (.result(inst140_result));
  LPM_MULT #(.INPUT_A_IS_CONSTANT("NO"), .INPUT_B_IS_CONSTANT("NO"), .LPM_PIPELINE(0), .LPM_REPRESENTATION("SIGNED"), .LPM_WIDTHA(24), .LPM_WIDTHB(16), .LPM_WIDTHP(40), .LPM_WIDTHS("LPM_WIDTHA"), .MAXIMIZE_SPEED(0)) inst82 (
    .dataa(inst83_result), .datab(inst84_result), .result(result28));  // open: clock, aclr, sclr, clken
  LPM_MULT #(.INPUT_A_IS_CONSTANT("NO"), .INPUT_B_IS_CONSTANT("NO"), .LPM_PIPELINE(0), .LPM_REPRESENTATION("SIGNED"), .LPM_WIDTHA(24), .LPM_WIDTHB(16), .LPM_WIDTHP(40), .LPM_WIDTHS("LPM_WIDTHA"), .MAXIMIZE_SPEED(0)) inst86 (
    .dataa(inst85_result), .datab(inst87_result), .result(result29));  // open: clock, aclr, sclr, clken
  LPM_MULT #(.INPUT_A_IS_CONSTANT("NO"), .INPUT_B_IS_CONSTANT("NO"), .LPM_PIPELINE(0), .LPM_REPRESENTATION("SIGNED"), .LPM_WIDTHA(24), .LPM_WIDTHB(16), .LPM_WIDTHP(40), .LPM_WIDTHS("LPM_WIDTHA"), .MAXIMIZE_SPEED(0)) inst89 (
    .dataa(inst88_result), .datab(inst90_result), .result(result30));  // open: clock, aclr, sclr, clken
  LPM_MULT #(.INPUT_A_IS_CONSTANT("NO"), .INPUT_B_IS_CONSTANT("NO"), .LPM_PIPELINE(0), .LPM_REPRESENTATION("SIGNED"), .LPM_WIDTHA(24), .LPM_WIDTHB(16), .LPM_WIDTHP(40), .LPM_WIDTHS("LPM_WIDTHA"), .MAXIMIZE_SPEED(0)) inst92 (
    .dataa(inst91_result), .datab(inst93_result), .result(result31));  // open: clock, aclr, sclr, clken
  LPM_MULT #(.INPUT_A_IS_CONSTANT("NO"), .INPUT_B_IS_CONSTANT("NO"), .LPM_PIPELINE(0), .LPM_REPRESENTATION("SIGNED"), .LPM_WIDTHA(24), .LPM_WIDTHB(16), .LPM_WIDTHP(40), .LPM_WIDTHS("LPM_WIDTHA"), .MAXIMIZE_SPEED(0)) inst94 (
    .dataa(inst95_result), .datab(inst96_result), .result(result32));  // open: clock, aclr, sclr, clken
  LPM_MULT #(.INPUT_A_IS_CONSTANT("NO"), .INPUT_B_IS_CONSTANT("NO"), .LPM_PIPELINE(0), .LPM_REPRESENTATION("SIGNED"), .LPM_WIDTHA(24), .LPM_WIDTHB(16), .LPM_WIDTHP(40), .LPM_WIDTHS("LPM_WIDTHA"), .MAXIMIZE_SPEED(0)) inst97 (
    .dataa(inst98_result), .datab(inst99_result), .result(result33));  // open: clock, aclr, sclr, clken
  LPM_MULT #(.INPUT_A_IS_CONSTANT("NO"), .INPUT_B_IS_CONSTANT("NO"), .LPM_PIPELINE(0), .LPM_REPRESENTATION("SIGNED"), .LPM_WIDTHA(24), .LPM_WIDTHB(16), .LPM_WIDTHP(40), .LPM_WIDTHS("LPM_WIDTHA"), .MAXIMIZE_SPEED(0)) inst101 (
    .dataa(inst100_result), .datab(inst102_result), .result(result34));  // open: clock, aclr, sclr, clken
  LPM_MULT #(.INPUT_A_IS_CONSTANT("NO"), .INPUT_B_IS_CONSTANT("NO"), .LPM_PIPELINE(0), .LPM_REPRESENTATION("SIGNED"), .LPM_WIDTHA(24), .LPM_WIDTHB(16), .LPM_WIDTHP(40), .LPM_WIDTHS("LPM_WIDTHA"), .MAXIMIZE_SPEED(0)) inst104 (
    .dataa(inst103_result), .datab(inst105_result), .result(result35));  // open: clock, aclr, sclr, clken
  LPM_MULT #(.INPUT_A_IS_CONSTANT("NO"), .INPUT_B_IS_CONSTANT("NO"), .LPM_PIPELINE(0), .LPM_REPRESENTATION("SIGNED"), .LPM_WIDTHA(24), .LPM_WIDTHB(16), .LPM_WIDTHP(40), .LPM_WIDTHS("LPM_WIDTHA"), .MAXIMIZE_SPEED(0)) inst107 (
    .dataa(inst106_result), .datab(inst108_result), .result(result36));  // open: clock, aclr, sclr, clken
  LPM_MULT #(.INPUT_A_IS_CONSTANT("NO"), .INPUT_B_IS_CONSTANT("NO"), .LPM_PIPELINE(0), .LPM_REPRESENTATION("SIGNED"), .LPM_WIDTHA(24), .LPM_WIDTHB(16), .LPM_WIDTHP(40), .LPM_WIDTHS("LPM_WIDTHA"), .MAXIMIZE_SPEED(0)) inst110 (
    .dataa(inst109_result), .datab(inst111_result), .result(result37));  // open: clock, aclr, sclr, clken
  LPM_MULT #(.INPUT_A_IS_CONSTANT("NO"), .INPUT_B_IS_CONSTANT("NO"), .LPM_PIPELINE(0), .LPM_REPRESENTATION("SIGNED"), .LPM_WIDTHA(24), .LPM_WIDTHB(16), .LPM_WIDTHP(40), .LPM_WIDTHS("LPM_WIDTHA"), .MAXIMIZE_SPEED(0)) inst113 (
    .dataa(inst112_result), .datab(inst114_result), .result(result38));  // open: clock, aclr, sclr, clken
  LPM_MULT #(.INPUT_A_IS_CONSTANT("NO"), .INPUT_B_IS_CONSTANT("NO"), .LPM_PIPELINE(0), .LPM_REPRESENTATION("SIGNED"), .LPM_WIDTHA(24), .LPM_WIDTHB(16), .LPM_WIDTHP(40), .LPM_WIDTHS("LPM_WIDTHA"), .MAXIMIZE_SPEED(0)) inst116 (
    .dataa(inst115_result), .datab(inst117_result), .result(result39));  // open: clock, aclr, sclr, clken
  LPM_MULT #(.INPUT_A_IS_CONSTANT("NO"), .INPUT_B_IS_CONSTANT("NO"), .LPM_PIPELINE(0), .LPM_REPRESENTATION("SIGNED"), .LPM_WIDTHA(24), .LPM_WIDTHB(16), .LPM_WIDTHP(40), .LPM_WIDTHS("LPM_WIDTHA"), .MAXIMIZE_SPEED(0)) inst119 (
    .dataa(inst118_result), .datab(inst120_result), .result(result40));  // open: clock, aclr, sclr, clken
  LPM_MULT #(.INPUT_A_IS_CONSTANT("NO"), .INPUT_B_IS_CONSTANT("NO"), .LPM_PIPELINE(0), .LPM_REPRESENTATION("SIGNED"), .LPM_WIDTHA(24), .LPM_WIDTHB(16), .LPM_WIDTHP(40), .LPM_WIDTHS("LPM_WIDTHA"), .MAXIMIZE_SPEED(0)) inst122 (
    .dataa(inst121_result), .datab(inst123_result), .result(result41));  // open: clock, aclr, sclr, clken
  LPM_MULT #(.INPUT_A_IS_CONSTANT("NO"), .INPUT_B_IS_CONSTANT("NO"), .LPM_PIPELINE(0), .LPM_REPRESENTATION("SIGNED"), .LPM_WIDTHA(24), .LPM_WIDTHB(16), .LPM_WIDTHP(40), .LPM_WIDTHS("LPM_WIDTHA"), .MAXIMIZE_SPEED(0)) inst125 (
    .dataa(inst124_result), .datab(inst126_result), .result(result42));  // open: clock, aclr, sclr, clken
  LPM_MULT #(.INPUT_A_IS_CONSTANT("NO"), .INPUT_B_IS_CONSTANT("NO"), .LPM_PIPELINE(0), .LPM_REPRESENTATION("SIGNED"), .LPM_WIDTHA(24), .LPM_WIDTHB(16), .LPM_WIDTHP(40), .LPM_WIDTHS("LPM_WIDTHA"), .MAXIMIZE_SPEED(0)) inst128 (
    .dataa(inst127_result), .datab(inst129_result), .result(result43));  // open: clock, aclr, sclr, clken
  LPM_MULT #(.INPUT_A_IS_CONSTANT("NO"), .INPUT_B_IS_CONSTANT("NO"), .LPM_PIPELINE(0), .LPM_REPRESENTATION("SIGNED"), .LPM_WIDTHA(24), .LPM_WIDTHB(16), .LPM_WIDTHP(40), .LPM_WIDTHS("LPM_WIDTHA"), .MAXIMIZE_SPEED(0)) inst131 (
    .dataa(inst130_result), .datab(inst132_result), .result(result44));  // open: clock, aclr, sclr, clken
  LPM_MULT #(.INPUT_A_IS_CONSTANT("NO"), .INPUT_B_IS_CONSTANT("NO"), .LPM_PIPELINE(0), .LPM_REPRESENTATION("SIGNED"), .LPM_WIDTHA(24), .LPM_WIDTHB(16), .LPM_WIDTHP(40), .LPM_WIDTHS("LPM_WIDTHA"), .MAXIMIZE_SPEED(0)) inst134 (
    .dataa(inst133_result), .datab(inst135_result), .result(result45));  // open: clock, aclr, sclr, clken
  LPM_MULT #(.INPUT_A_IS_CONSTANT("NO"), .INPUT_B_IS_CONSTANT("NO"), .LPM_PIPELINE(0), .LPM_REPRESENTATION("SIGNED"), .LPM_WIDTHA(24), .LPM_WIDTHB(16), .LPM_WIDTHP(40), .LPM_WIDTHS("LPM_WIDTHA"), .MAXIMIZE_SPEED(0)) inst138 (
    .dataa(inst137_result), .datab(inst136_result), .result(result46));  // open: clock, aclr, sclr, clken
  LPM_MULT #(.INPUT_A_IS_CONSTANT("NO"), .INPUT_B_IS_CONSTANT("NO"), .LPM_PIPELINE(0), .LPM_REPRESENTATION("SIGNED"), .LPM_WIDTHA(24), .LPM_WIDTHB(16), .LPM_WIDTHP(40), .LPM_WIDTHS("LPM_WIDTHA"), .MAXIMIZE_SPEED(0)) inst150 (
    .dataa(inst149_result), .datab(inst148_result), .result(result50));  // open: clock, aclr, sclr, clken
  arbolsumador inst152 (.dataa(result03), .datab(result04), .result(result2a));
  LPM_MULT #(.INPUT_A_IS_CONSTANT("NO"), .INPUT_B_IS_CONSTANT("NO"), .LPM_PIPELINE(0), .LPM_REPRESENTATION("SIGNED"), .LPM_WIDTHA(24), .LPM_WIDTHB(16), .LPM_WIDTHP(40), .LPM_WIDTHS("LPM_WIDTHA"), .MAXIMIZE_SPEED(0)) inst141 (
    .dataa(inst139_result), .datab(inst140_result), .result(result47));  // open: clock, aclr, sclr, clken
  LPM_MULT #(.INPUT_A_IS_CONSTANT("NO"), .INPUT_B_IS_CONSTANT("NO"), .LPM_PIPELINE(0), .LPM_REPRESENTATION("SIGNED"), .LPM_WIDTHA(24), .LPM_WIDTHB(16), .LPM_WIDTHP(40), .LPM_WIDTHS("LPM_WIDTHA"), .MAXIMIZE_SPEED(0)) inst143 (
    .dataa(inst142_result), .datab(inst144_result), .result(result48));  // open: clock, aclr, sclr, clken
  LPM_MULT #(.INPUT_A_IS_CONSTANT("NO"), .INPUT_B_IS_CONSTANT("NO"), .LPM_PIPELINE(0), .LPM_REPRESENTATION("SIGNED"), .LPM_WIDTHA(24), .LPM_WIDTHB(16), .LPM_WIDTHP(40), .LPM_WIDTHS("LPM_WIDTHA"), .MAXIMIZE_SPEED(0)) inst146 (
    .dataa(inst145_result), .datab(inst147_result), .result(result49));  // open: clock, aclr, sclr, clken
  arbolsumador inst151 (.dataa(result01), .datab(result02), .result(result1a));
  arbolsumador inst153 (.dataa(result05), .datab(result06), .result(result3a));
  arbolsumador inst154 (.dataa(result07), .datab(result08), .result(result4a));
  arbolsumador inst155 (.dataa(result09), .datab(result10), .result(result5a));
  arbolsumador inst156 (.dataa(result11), .datab(result12), .result(result6a));
  arbolsumador inst157 (.dataa(result13), .datab(result14), .result(result7a));
  arbolsumador inst158 (.dataa(result15), .datab(result16), .result(result8a));
  arbolsumador inst159 (.dataa(result17), .datab(result18), .result(result9a));
  arbolsumador inst160 (.dataa(result19), .datab(result20), .result(result10a));
  arbolsumador inst161 (.dataa(result21), .datab(result22), .result(result11a));
  arbolsumador inst162 (.dataa(result23), .datab(result24), .result(result12a));
  arbolsumador inst164 (.dataa(result27), .datab(result28), .result(result14a));
  arbolsumador inst165 (.dataa(result29), .datab(result30), .result(result15a));
  arbolsumador inst166 (.dataa(result31), .datab(result32), .result(result16a));
  arbolsumador inst167 (.dataa(result33), .datab(result34), .result(result17a));
  arbolsumador inst168 (.dataa(result35), .datab(result36), .result(result18a));
  arbolsumador inst169 (.dataa(result37), .datab(result38), .result(result19a));
  arbolsumador inst170 (.dataa(result39), .datab(result40), .result(result20a));
  arbolsumador inst171 (.dataa(result41), .datab(result42), .result(result21a));
  arbolsumador inst172 (.dataa(result43), .datab(result44), .result(result22a));
  arbolsumador inst173 (.dataa(result45), .datab(result46), .result(result23a));
  arbolsumador inst174 (.dataa(result47), .datab(result48), .result(result24a));
  arbolsumador inst175 (.dataa(result49), .datab(result50), .result(result25a));
  arbolsumador inst163 (.dataa(result25), .datab(result26), .result(result13a));
  arbolsumador inst176 (.dataa(result1a), .datab(result2a), .result(result1b));
  arbolsumador inst177 (.dataa(result3a), .datab(result4a), .result(result2b));
  arbolsumador inst178 (.dataa(result5a), .datab(result6a), .result(result3b));
  arbolsumador inst179 (.dataa(result7a), .datab(result8a), .result(result4b));
  arbolsumador inst180 (.dataa(result9a), .datab(result10a), .result(result5b));
  arbolsumador inst181 (.dataa(result11a), .datab(result12a), .result(result6b));
  arbolsumador inst182 (.dataa(result13a), .datab(result14a), .result(result7b));
  arbolsumador inst183 (.dataa(result15a), .datab(result16a), .result(result8b));
  arbolsumador inst184 (.dataa(result17a), .datab(result18a), .result(result9b));
  arbolsumador inst185 (.dataa(result19a), .datab(result20a), .result(result10b));
  arbolsumador inst186 (.dataa(result21a), .datab(result22a), .result(result11b));
  arbolsumador inst187 (.dataa(result23a), .datab(result24a), .result(result12b));
  arbolsumador inst188 (.dataa(result1b), .datab(result2b), .result(result1c));
  arbolsumador inst189 (.dataa(result3b), .datab(result4b), .result(result2c));
  arbolsumador inst191 (.dataa(result5b), .datab(result6b), .result(result3c));
  arbolsumador inst190 (.dataa(result7b), .datab(result8b), .result(result4c));
  arbolsumador inst193 (.dataa(result9b), .datab(result10b), .result(result5c));
  arbolsumador inst192 (.dataa(result11b), .datab(result12b), .result(result6c));
  arbolsumador inst194 (.dataa(result1c), .datab(result2c), .result(result1d));
  arbolsumador inst195 (.dataa(result3c), .datab(result4c), .result(result2d));
  arbolsumador inst196 (.dataa(result5c), .datab(result6c), .result(result3d));
  arbolsumador inst197 (.dataa(result1d), .datab(result2d), .result(result1e));
  arbolsumador inst198 (.dataa(result3d), .datab(result25a), .result(result2e));
  arbolsumador inst199 (.dataa(result1e), .datab(result2e), .result(result1f));
endmodule
